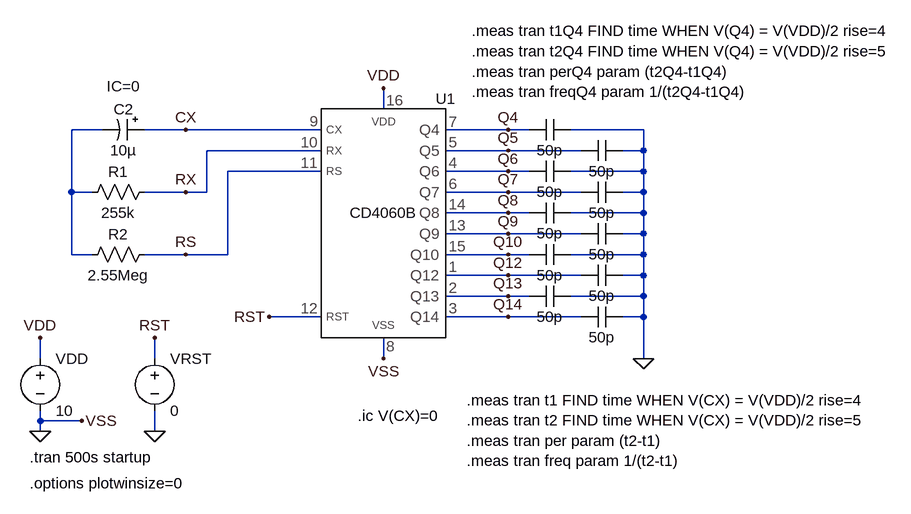
[diagram p0: schematic CD4060BTest.asc]
CD4060BTest.asc, the LTspice schematic file:
Version 4
SHEET 1 1844 1136
WIRE -352 -368 -352 -400
WIRE -784 -336 -832 -336
WIRE -656 -336 -720 -336
WIRE -448 -336 -656 -336
WIRE -160 -336 -256 -336
WIRE -128 -336 -160 -336
WIRE 48 -336 -64 -336
WIRE -448 -304 -624 -304
WIRE -160 -304 -256 -304
WIRE -48 -304 -160 -304
WIRE 48 -304 48 -336
WIRE 48 -304 16 -304
WIRE -448 -272 -592 -272
WIRE -160 -272 -256 -272
WIRE -128 -272 -160 -272
WIRE 48 -272 48 -304
WIRE 48 -272 -64 -272
WIRE -832 -240 -832 -336
WIRE -800 -240 -832 -240
WIRE -656 -240 -720 -240
WIRE -624 -240 -624 -304
WIRE -624 -240 -656 -240
WIRE -160 -240 -256 -240
WIRE -48 -240 -160 -240
WIRE 48 -240 48 -272
WIRE 48 -240 16 -240
WIRE -160 -208 -256 -208
WIRE -128 -208 -160 -208
WIRE 48 -208 48 -240
WIRE 48 -208 -64 -208
WIRE -160 -176 -256 -176
WIRE -48 -176 -160 -176
WIRE 48 -176 48 -208
WIRE 48 -176 16 -176
WIRE -832 -144 -832 -240
WIRE -800 -144 -832 -144
WIRE -656 -144 -720 -144
WIRE -592 -144 -592 -272
WIRE -592 -144 -656 -144
WIRE -160 -144 -256 -144
WIRE -128 -144 -160 -144
WIRE 48 -144 48 -176
WIRE 48 -144 -64 -144
WIRE -160 -112 -256 -112
WIRE -48 -112 -160 -112
WIRE 48 -112 48 -144
WIRE 48 -112 16 -112
WIRE -160 -80 -256 -80
WIRE -128 -80 -160 -80
WIRE 48 -80 48 -112
WIRE 48 -80 -64 -80
WIRE -448 -48 -528 -48
WIRE -160 -48 -256 -48
WIRE -48 -48 -160 -48
WIRE 48 -48 48 -80
WIRE 48 -48 16 -48
WIRE -880 16 -880 -16
WIRE -704 16 -704 -16
WIRE -352 16 -352 -16
WIRE 48 16 48 -48
WIRE -880 112 -880 96
WIRE -816 112 -880 112
WIRE -880 128 -880 112
WIRE -704 128 -704 96
FLAG -704 128 0
FLAG -704 -16 RST
FLAG -880 128 0
FLAG -880 -16 VDD
FLAG -816 112 VSS
FLAG -656 -336 CX
FLAG -656 -240 RX
FLAG -656 -144 RS
FLAG -352 16 VSS
FLAG -352 -400 VDD
FLAG -528 -48 RST
FLAG 48 16 0
FLAG -160 -336 Q4
FLAG -160 -304 Q5
FLAG -160 -272 Q6
FLAG -160 -240 Q7
FLAG -160 -208 Q8
FLAG -160 -176 Q9
FLAG -160 -144 Q10
FLAG -160 -112 Q12
FLAG -160 -80 Q13
FLAG -160 -48 Q14
SYMBOL voltage -704 0 R0
WINDOW 123 0 0 Left 2
WINDOW 39 0 0 Left 2
SYMATTR InstName VRST
SYMATTR Value 0
SYMBOL voltage -880 0 R0
WINDOW 123 0 0 Left 2
WINDOW 39 0 0 Left 2
SYMATTR InstName VDD
SYMATTR Value 10
SYMBOL polcap -720 -352 R90
WINDOW 0 0 32 VBottom 2
WINDOW 3 32 32 VTop 2
WINDOW 123 -35 32 VBottom 2
SYMATTR InstName C2
SYMATTR Value 10µ
SYMATTR Value2 IC=0
SYMATTR Description Capacitor
SYMATTR Type cap
SYMATTR SpiceLine V=25 Irms=1.3 Rser=0.06 Lser=0 mfg="KEMET" pn="T521T106M025ATE060" type="Tantalum"
SYMBOL res -704 -256 R90
WINDOW 0 0 56 VBottom 2
WINDOW 3 32 56 VTop 2
SYMATTR InstName R1
SYMATTR Value 255k
SYMBOL res -704 -160 R90
WINDOW 0 0 56 VBottom 2
WINDOW 3 32 56 VTop 2
SYMATTR InstName R2
SYMATTR Value 2.55Meg
SYMBOL cap -64 -352 R90
WINDOW 0 0 32 Invisible 2
WINDOW 3 32 32 VTop 2
SYMATTR InstName C1
SYMATTR Value 50p
SYMBOL cap 16 -320 R90
WINDOW 0 0 32 Invisible 2
WINDOW 3 32 32 VTop 2
SYMATTR InstName C3
SYMATTR Value 50p
SYMBOL cap -64 -288 R90
WINDOW 0 0 32 Invisible 2
WINDOW 3 32 32 VTop 2
SYMATTR InstName C4
SYMATTR Value 50p
SYMBOL cap 16 -256 R90
WINDOW 0 0 32 Invisible 2
WINDOW 3 32 32 VTop 2
SYMATTR InstName C5
SYMATTR Value 50p
SYMBOL cap -64 -224 R90
WINDOW 0 0 32 Invisible 2
WINDOW 3 32 32 VTop 2
SYMATTR InstName C6
SYMATTR Value 50p
SYMBOL cap 16 -192 R90
WINDOW 0 0 32 Invisible 2
WINDOW 3 32 32 VTop 2
SYMATTR InstName C7
SYMATTR Value 50p
SYMBOL cap -64 -160 R90
WINDOW 0 0 32 Invisible 2
WINDOW 3 32 32 VTop 2
SYMATTR InstName C8
SYMATTR Value 50p
SYMBOL cap 16 -128 R90
WINDOW 0 0 32 Invisible 2
WINDOW 3 32 32 VTop 2
SYMATTR InstName C9
SYMATTR Value 50p
SYMBOL cap -64 -96 R90
WINDOW 0 0 32 Invisible 2
WINDOW 3 32 32 VTop 2
SYMATTR InstName C10
SYMATTR Value 50p
SYMBOL cap 16 -64 R90
WINDOW 0 0 32 Invisible 2
WINDOW 3 32 32 VTop 2
SYMATTR InstName C11
SYMATTR Value 50p
SYMBOL CD4060B -352 -208 R0
SYMATTR InstName U1
TEXT -896 168 Left 2 !.tran 500s startup
TEXT -392 104 Left 2 !.ic V(CX)=0
TEXT -896 208 Left 2 !.options plotwinsize=0
TEXT -224 80 Left 2 !.meas tran t1 FIND time WHEN V(CX) = V(VDD)/2 rise=4\n.meas tran t2 FIND time WHEN V(CX) = V(VDD)/2 rise=5\n.meas tran per param (t2-t1)\n.meas tran freq param 1/(t2-t1)
TEXT -216 -488 Left 2 !.meas tran t1Q4 FIND time WHEN V(Q4) = V(VDD)/2 rise=4\n.meas tran t2Q4 FIND time WHEN V(Q4) = V(VDD)/2 rise=5\n.meas tran perQ4 param (t2Q4-t1Q4)\n.meas tran freqQ4 param 1/(t2Q4-t1Q4)

The netlist it stands for:
* CD4060BTest.asc
VRST RST 0 0
VDD VDD 0 10
C2 CX N001 10µ IC=0 V=25 Irms=1.3 Rser=0.06 Lser=0 mfg="KEMET" pn="T521T106M025ATE060" type="Tantalum"
R1 RX N001 255k
R2 RS N001 2.55Meg
C1 0 Q4 50p
C3 0 Q5 50p
C4 0 Q6 50p
C5 0 Q7 50p
C6 0 Q8 50p
C7 0 Q9 50p
C8 0 Q10 50p
C9 0 Q12 50p
C10 0 Q13 50p
C11 0 Q14 50p
XU1 RS RST CX Q10 Q12 Q13 Q14 Q4 Q5 Q6 Q7 Q8 Q9 RX VDD 0 CD4060B  ; pins RS RST CX Q10Out Q12Out Q13Out Q14Out Q4Out Q5Out Q6Out Q7Out Q8Out Q9Out RX VDD VSS
.tran 500s startup
.ic V(CX)=0
.options plotwinsize=0
.meas tran t1 FIND time WHEN V(CX) = V(VDD)/2 rise=4
.meas tran t2 FIND time WHEN V(CX) = V(VDD)/2 rise=5
.meas tran per param (t2-t1)
.meas tran freq param 1/(t2-t1)
.meas tran t1Q4 FIND time WHEN V(Q4) = V(VDD)/2 rise=4
.meas tran t2Q4 FIND time WHEN V(Q4) = V(VDD)/2 rise=5
.meas tran perQ4 param (t2Q4-t1Q4)
.meas tran freqQ4 param 1/(t2Q4-t1Q4)
.lib CD4060B.lib
.backanno
.end